# Altium schematic sheet bootload_wifi.SchDoc
size A4; SheetNumber: 15; SheetTotal: 17
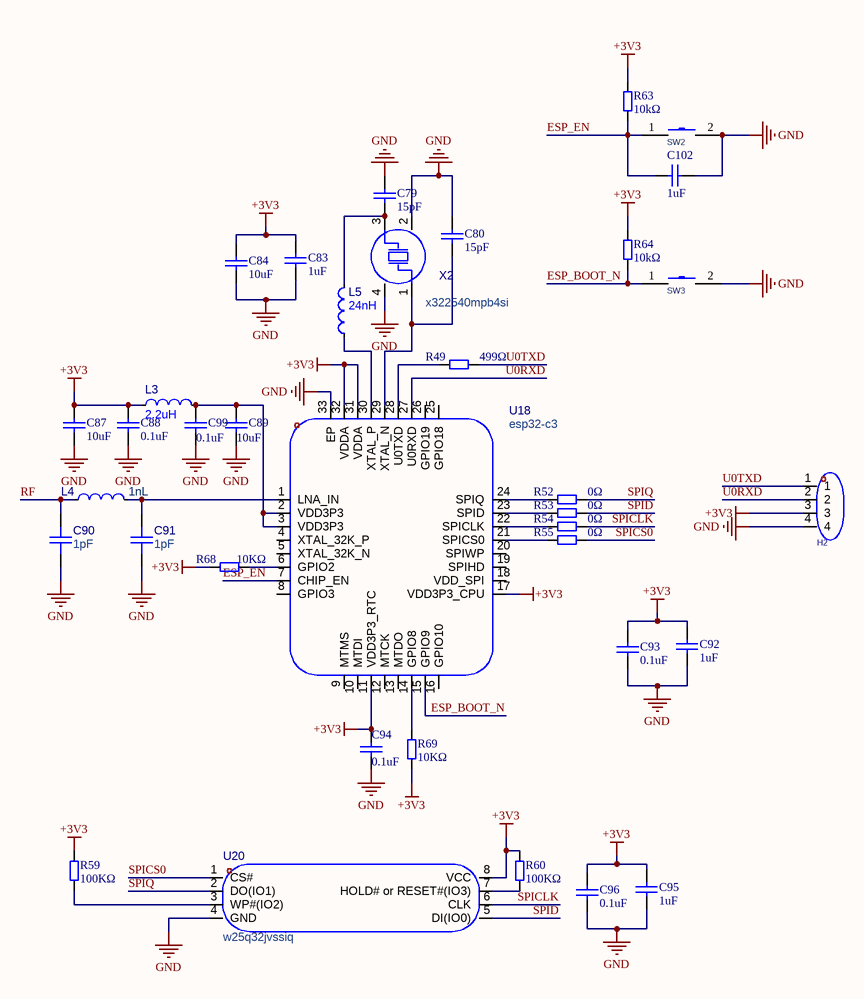
[diagram p0: bootload_wifi.SchDoc]

## Parts
C79  15pF  [C0603]
C80  15pF  [C0603]
C83  1uF  [C0603]
C84  10uF  [C0603]
C87  10uF  [C0603]
C88  0.1uF  [C0603]
C89  10uF  [C0603]
C90  1pF  [C0201]
C91  1pF  [C0201]
C92  1uF  [C0603]
C93  0.1uF  [C0603]
C94  0.1uF  [C0603]
C95  1uF  [C0603]
C96  0.1uF  [C0603]
C99  0.1uF  [C0603]
C102  1uF  [C0603]
H2  lail-pz2.54-4p-l  [CONN-TH_LAIL-PZ2.54-4P-L]  (value not drawn)
L3  2.2uH  [L0603]
L4  1nL  [L0201-RD]
L5  24nH  [L0603]
R49  499Ω  [R0603]
R52  0Ω  [R0603]
R53  0Ω  [R0603]
R54  0Ω  [R0603]
R55  0Ω  [R0603]
R59  100KΩ  [R0603]
R60  100KΩ  [R0603]
R63  10kΩ  [R0603]
R64  10kΩ  [R0603]
R68  10KΩ  [R0603]
R69  10KΩ  [R0603]
SW2  TS-1101-C-W  [SW-SMD_L6.0-W3.3-LS8.0]  (value not drawn)
SW3  TS-1101-C-W  [SW-SMD_L6.0-W3.3-LS8.0]  (value not drawn)
U18  esp32-c3  [QFN-32_L5.0-W5.0-P0.50-TL-EP3.7]
U20  w25q32jvssiq  [SOIC-8_L5.3-W5.3-P1.27-LS8.0-BL]
X2  x322540mpb4si  [OSC-SMD_4P-L3.2-W2.5-BL_SIT8008BI]

## Nets
+3V3: C83.2 C84.2 C87.2 C88.2 C92.2 C93.2 C94.2 C95.2 C96.2 H2.3 L3.1 R59.2 R60.2 R63.2 R64.2 R68.2 R69.1 U18.11(VDD3P3_RTC) U18.17(VDD3P3_CPU) U18.31(VDDA) U18.32(VDDA) U20.8(VCC)
GND: C79.1 C80.2 C83.1 C84.1 C87.1 C88.1 C89.1 C90.1 C91.1 C92.1 C93.1 C94.1 C95.1 C96.1 C99.1 C102.1 H2.4 SW2.2 SW3.2 U18.33(EP) U20.4(GND) X2.2(GND) X2.4(GND)
ESP_BOOT_N: R64.1 SW3.1 U18.15(GPIO9)
ESP_EN: C102.2 R63.1 SW2.1 U18.7(CHIP_EN)
RF: C90.2 L4.1
SPICLK: R54.2 U20.6(CLK)
SPICS0: R55.2 U20.1(CS#)
SPID: R53.2 U20.5(DI(IO0))
SPIQ: R52.2 U20.2(DO(IO1))
U0RXD: H2.2 U18.27(U0RXD)
U0TXD: H2.1 R49.2
NetC79_2: C79.2 L5.2 X2.3(OSC2)
NetC80_1: C80.1 U18.29(XTAL_N) X2.1(OSC1)
NetC89_2: C89.2 C99.2 L3.2 U18.2(VDD3P3) U18.3(VDD3P3)
NetC91_2: C91.2 L4.2 U18.1(LNA_IN)
NetL5_1: L5.1 U18.30(XTAL_P)
NetR49_1: R49.1 U18.28(U0TXD)
NetR52_1: R52.1 U18.24(SPIQ)
NetR53_1: R53.1 U18.23(SPID)
NetR54_1: R54.1 U18.22(SPICLK)
NetR55_1: R55.1 U18.21(SPICS0)
NetR59_1: R59.1 U20.3(WP#(IO2))
NetR60_1: R60.1 U20.7(HOLD#_or_RESET#(IO3))
NetR68_1: R68.1 U18.6(GPIO2)
NetR69_2: R69.2 U18.14(GPIO8)

Not connected (* = marked no-connect by the designer): U18 4(XTAL_32K_P) 5(XTAL_32K_N) 8(GPIO3) 9(MTMS) 10(MTDI) 12(MTCK) 13(MTDO) 16(GPIO10) 18(VDD_SPI) 19(SPIHD) 20(SPIWP) 25(GPIO18) 26(GPIO19)

## Library data of the parts
C79 C80 C83 C84 C87-C89 C92-C96 C99 C102 = C0603: Capacitor; Value: 104; Published: 8-Jun-2000; LatestRevisionDate: 17-Jul-2002; LatestRevisionNote: Re-released for DXP Platform.; Publisher: Altium Limited
C90 C91 = 0201-C: 容值:1uF;精度:±20%;额定电压:6.3V;温度系数:X5R;; Manufacturer: muRata(村田); Symbol: GRM033R60J105MEA2D; AddInBom: yes; ModelId: e8033a7cb35143ffb28e3b81b2577ea0; ModelName: C0201_L0.6-W0.3-H0.3; ModelTransform: 23.622,11.811,0,0,0,0,0,0,0; Value: 1uF; Tolerance: ±20%; Voltage Rating: 6.3V; Temperature Coefficient: X5R; LCSC Part Name: 1uF ±20% 6.3V; SupplierPart: C76930; ManufacturerPart: GRM033R60J105MEA2D; Supplier Footprint: 0201; JLCPCB Part Class: Extended Part; Datasheet: https://item.szlcsc.com/datasheet/GRM033R60J105MEA2D/78057.html; Supplier: LCSC; ConvertToPcb: yes; FootprintName: C0201
H2 = lail-pz2.54-4p-l: 插针结构:1x4P;间距:2.54mm;圆针/方针:方针;排数:单排;总PIN位数:4P;额定电流:3A;额定电压:250V;塑高:2.5mm;端接针长度:3mm;触头材质:黄铜;触头镀层:金;工作温度:-25℃~+80℃;颜色:黑色;; Manufacturer: 莱联; AddInBom: yes; ModelId: 112b012cb4004446aa5386c9c86d05f0; ModelTransform: 400.039,100,0,0,0,0,0,0,-118.11; Pin Structure: 1x4P; Pitch: 2.54mm; Circluar Pins/Square Pins: 方针; Current Rating: 3A; Voltage Rating (Max): 250V; LCSC Part Name: 1x4P 间距:2.54mm 方针; SupplierPart: C54950602; ManufacturerPart: LAIL-PZ2.54-4P-L; Supplier Footprint: 插件,P=2.54mm; JLCPCB Part Class: Extended Part; Datasheet: https://item.szlcsc.com/datasheet/LAIL-PZ2.54-4P-L/58519955.html; Supplier: LCSC; ConvertToPcb: yes; SymbolName: LAIL-PZ2.54-4P-L; FootprintName: CONN-TH_LAIL-PZ2.54-4P-L; ModelName: CONN-TH_LAIL-PZ2.54-4P-L; Number of Rows: 单排; Number of Pins: 4P; Insulation Height: 2.5mm; Length of End Connection Pin: 3mm; Contact Material: 黄铜; Contact Plating: 金; Operating Temperature: -25℃~+80℃; Color: 黑色
L3 L5 = L0603: 电感值:10uH;精度:±10%;额定电流:3mA;饱和电流(Isat):-;直流电阻(DCR):1.85Ω;; Manufacturer: Sunlord(顺络); Symbol: SDFL1608S100KTF; AddInBom: yes; ModelId: 2bc5ec593d464d6ba9807aec0b5673c2; ModelName: L0603_L1.6-W0.8-H0.5_BEAD; ModelTransform: 62.992,31.496,0,180,0,0,0.094,0.629,0; Value: 10uH; Tolerance: ±10%; Current Rating: 3mA; DC Resistance(DCR): 1.85Ω; Q @ Frequency: 30@2MHz; Frequency - Self Resonant: 17MHz; LCSC Part Name: 10uH ±10%; SupplierPart: C1035; ManufacturerPart: SDFL1608S100KTF; Supplier Footprint: 0603; JLCPCB Part Class: Basic Part; Datasheet: https://item.szlcsc.com/datasheet/SDFL1608S100KTF/1387.html; Supplier: LCSC; ConvertToPcb: yes; FootprintName: L0603; Current - Saturation (Isat): -; Ratings: -
L4 = 0201-L: 电感值:2nH;精度:-;额定电流:600mA;饱和电流(Isat):-;直流电阻(DCR):150mΩ;; Manufacturer: muRata(村田); Symbol: LQP03TN2N0B02D; AddInBom: yes; ModelId: 62bef5db133646c7914ab8b9bdc86b60; ModelTransform: 23.622,11.811,0,0,0,0,0,0,0; Value: 2nH; Current Rating: 600mA; DC Resistance(DCR): 150mΩ; Q @ Frequency: 14@500MHz; Frequency - Self Resonant: 12.5GHz; Type: 厚膜电感; LCSC Part Name: ±0.1nH 2nH; SupplierPart: C86125; ManufacturerPart: LQP03TN2N0B02D; Supplier Footprint: 0201; JLCPCB Part Class: Extended Part; Datasheet: https://item.szlcsc.com/datasheet/LQP03TN2N0B02D/87301.html; Supplier: LCSC; ConvertToPcb: yes; FootprintName: L0201-RD; ModelName: L0201-RD; Tolerance: -; Current - Saturation (Isat): -
R49 R52-R55 R59 R60 R63 R64 R68 R69 = 0603-1KΩ-5%: 片式电阻; 物料描述: 片式电阻器-0805-10KΩ-5%-JT; 物料号: NA
SW2 SW3 = TS-1101-C-W: Manufacturer: XKB Connectivity(中国星坤); Add into BOM: yes; Circuit: 单刀单掷; Actuator Style: 矩形按钮; Operating Force: 260gf; Switch Length: 6mm; Switch Width: 3.6mm; Switch Height: 2.5mm; Strike Gundam: 不带; Contact Current: 50mA; Voltage Rating (DC): 12V; Actuator/Cap Color: 白色带淡绿; With Lamp: 无; Mechanical Life: 5万次; Symbol: TS-1101-C-W; Device: TS-1101-C-W; LCSC Part Name: 6*3.6*2.5mm 立贴 轻触开关; Supplier Part: C318938; Manufacturer Part: TS-1101-C-W; Supplier Footprint: SMD; JLCPCB Part Class: Extended Part; Datasheet: https://atta.szlcsc.com/upload/public/pdf/source/20200227/C318938_C2E53B1EEDE37D980A33616AC086DE53.pdf; Supplier: LCSC; Convert to PCB: yes; Mounting Style: 立贴; Voltage Rating (AC): -; Power Rating: -; Insulation Resistance: -; IP Rating: -; Pin Style: -; Operating Temperature: -30℃~+85℃
U18 = esp32-c3: CPU内核:其他;CPU最大主频:160MHz;CPU位数:32 Bit;; Manufacturer: ESPRESSIF(乐鑫); AddInBom: yes; ModelId: 1b373353bf024628a0546c2e0a05c449; ModelName: QFN-32_L5.0-W5.0-H0.9-P0.50-TL-EP3.7; ModelTransform: 196.85,196.85,0,0,0,0,0,0,0; CPU Core: 其他; CPU Maximum Speed: 160MHz; Core Size: 32 Bit; RAM Size: 528KB; Number of I/O: 22; ADC (Bit): 12bit; Oscillator Type: 内置+外置; Voltage - Supply: 3V~3.6V; Symbol: ESP32-C3; LCSC Part Name: 不带固件 搭载RISC-V单核CPU的超低功耗片上系统（SoC），支持2.4 GHz Wi-Fi（802.11 b/g/n）和蓝牙5（低功耗）; SupplierPart: C2838500; ManufacturerPart: ESP32-C3; Supplier Footprint: QFN-32-EP(5x5); JLCPCB Part Class: Extended Part; Datasheet: https://item.szlcsc.com/datasheet/ESP32-C3/3013220.html; Supplier: LCSC; ConvertToPcb: yes; FootprintName: QFN-32_L5.0-W5.0-P0.50-TL-EP3.7; Operating Temperature: -40℃~+105℃
U20 = w25q32jvssiq: 接口类型:SPI;存储容量:32Mbit;时钟频率(fc):133MHz;; Manufacturer: Winbond(华邦); Symbol: W25Q32JVSSIQ_C179173; AddInBom: yes; ModelId: f83d990ad74f400caf5ac920b7771508; ModelName: SOIC-8_L5.3-W5.3-H1.9-LS7.9-P1.27; ModelTransform: 208.661,311.25654,0,0,0,0,-0.0005,0.0005,0; Interface: SPI; Memory Size: 32Mbit; Clock Frequency: 133MHz; Voltage - Supply: 2.7V~3.6V; Standby Supply Current: 1uA; Program / Erase Cycles: 100000次; Page Programming Time (Tpp): 3ms; Data Retention - TDR (Year): 20年; LCSC Part Name: 支持双线、四线SPI接口的3V、32Mbit 串行SPI闪存; SupplierPart: C179173; ManufacturerPart: W25Q32JVSSIQ; Supplier Footprint: SOIC-8-208mil; JLCPCB Part Class: Extended Part; Datasheet: https://item.szlcsc.com/datasheet/W25Q32JVSSIQ/190567.html; Supplier: LCSC; ConvertToPcb: yes; FootprintName: SOIC-8_L5.3-W5.3-P1.27-LS8.0-BL; Write Cycle Time (tWC): -; Block Erase Time(tBE): -; Operating Temperature: -40℃~+85℃; Features: 硬件写保护；绝对写保护；写使能锁存；软件写保护；上电复位
X2 = x322540mpb4si: 晶振类型:贴片晶振;频率:40MHz;常温频差:±10ppm;负载电容:15pF;频率稳定度:±20ppm;; Manufacturer: YXC(扬兴晶振); AddInBom: yes; ModelId: ae22b8d143894765bc8100c37cb6356f; ModelName: OSC-SMD_4P-L3.2-W2.5-H1.0; ModelTransform: 125.984,98.425,0,0,0,0,0,0,0; Value: 40MHz; Normal temperature Frequency Tolerance: ±10ppm; Load Capacitance: 15pF; Frequency Stability: ±20ppm; Equivalent Series Resistance(ESR): 40Ω; Symbol: X322540MPB4SI; LCSC Part Name: YSX321SL 40MHZ 4P 3225 15PF ±10PPM -40~85℃ (±20PPM); SupplierPart: C9010; ManufacturerPart: X322540MPB4SI; Supplier Footprint: SMD3225-4P; JLCPCB Part Class: Extended Part; Datasheet: https://item.szlcsc.com/datasheet/X322540MPB4SI/9530.html; Supplier: LCSC; ConvertToPcb: yes; FootprintName: OSC-SMD_4P-L3.2-W2.5-BL_SIT8008BI; Type: 贴片晶振; Operating Temperature: -40℃~+85℃